# Altium schematic sheet CM5_Boot_USB.SchDoc: 05 - CM5: boot, USB, UART, I2C e ventilacao
size A3; Project: CM5 Photonic Bias Controller; DocumentRev: R5; ProjectRev: R5; Version: Rev R6; SheetNumber: 6; SheetTotal: 17; Author: Carlos Renan; SCH_SCALE: N/A; Address1: UFCG; Address2: Referencia: VIRTUS CC; Address3: Campina Grande - PB; ProjectName: Controle automatico de BIAS para MZM/IQ - Projeto 3; DocumentName: CM5_Boot_USB.SchDoc
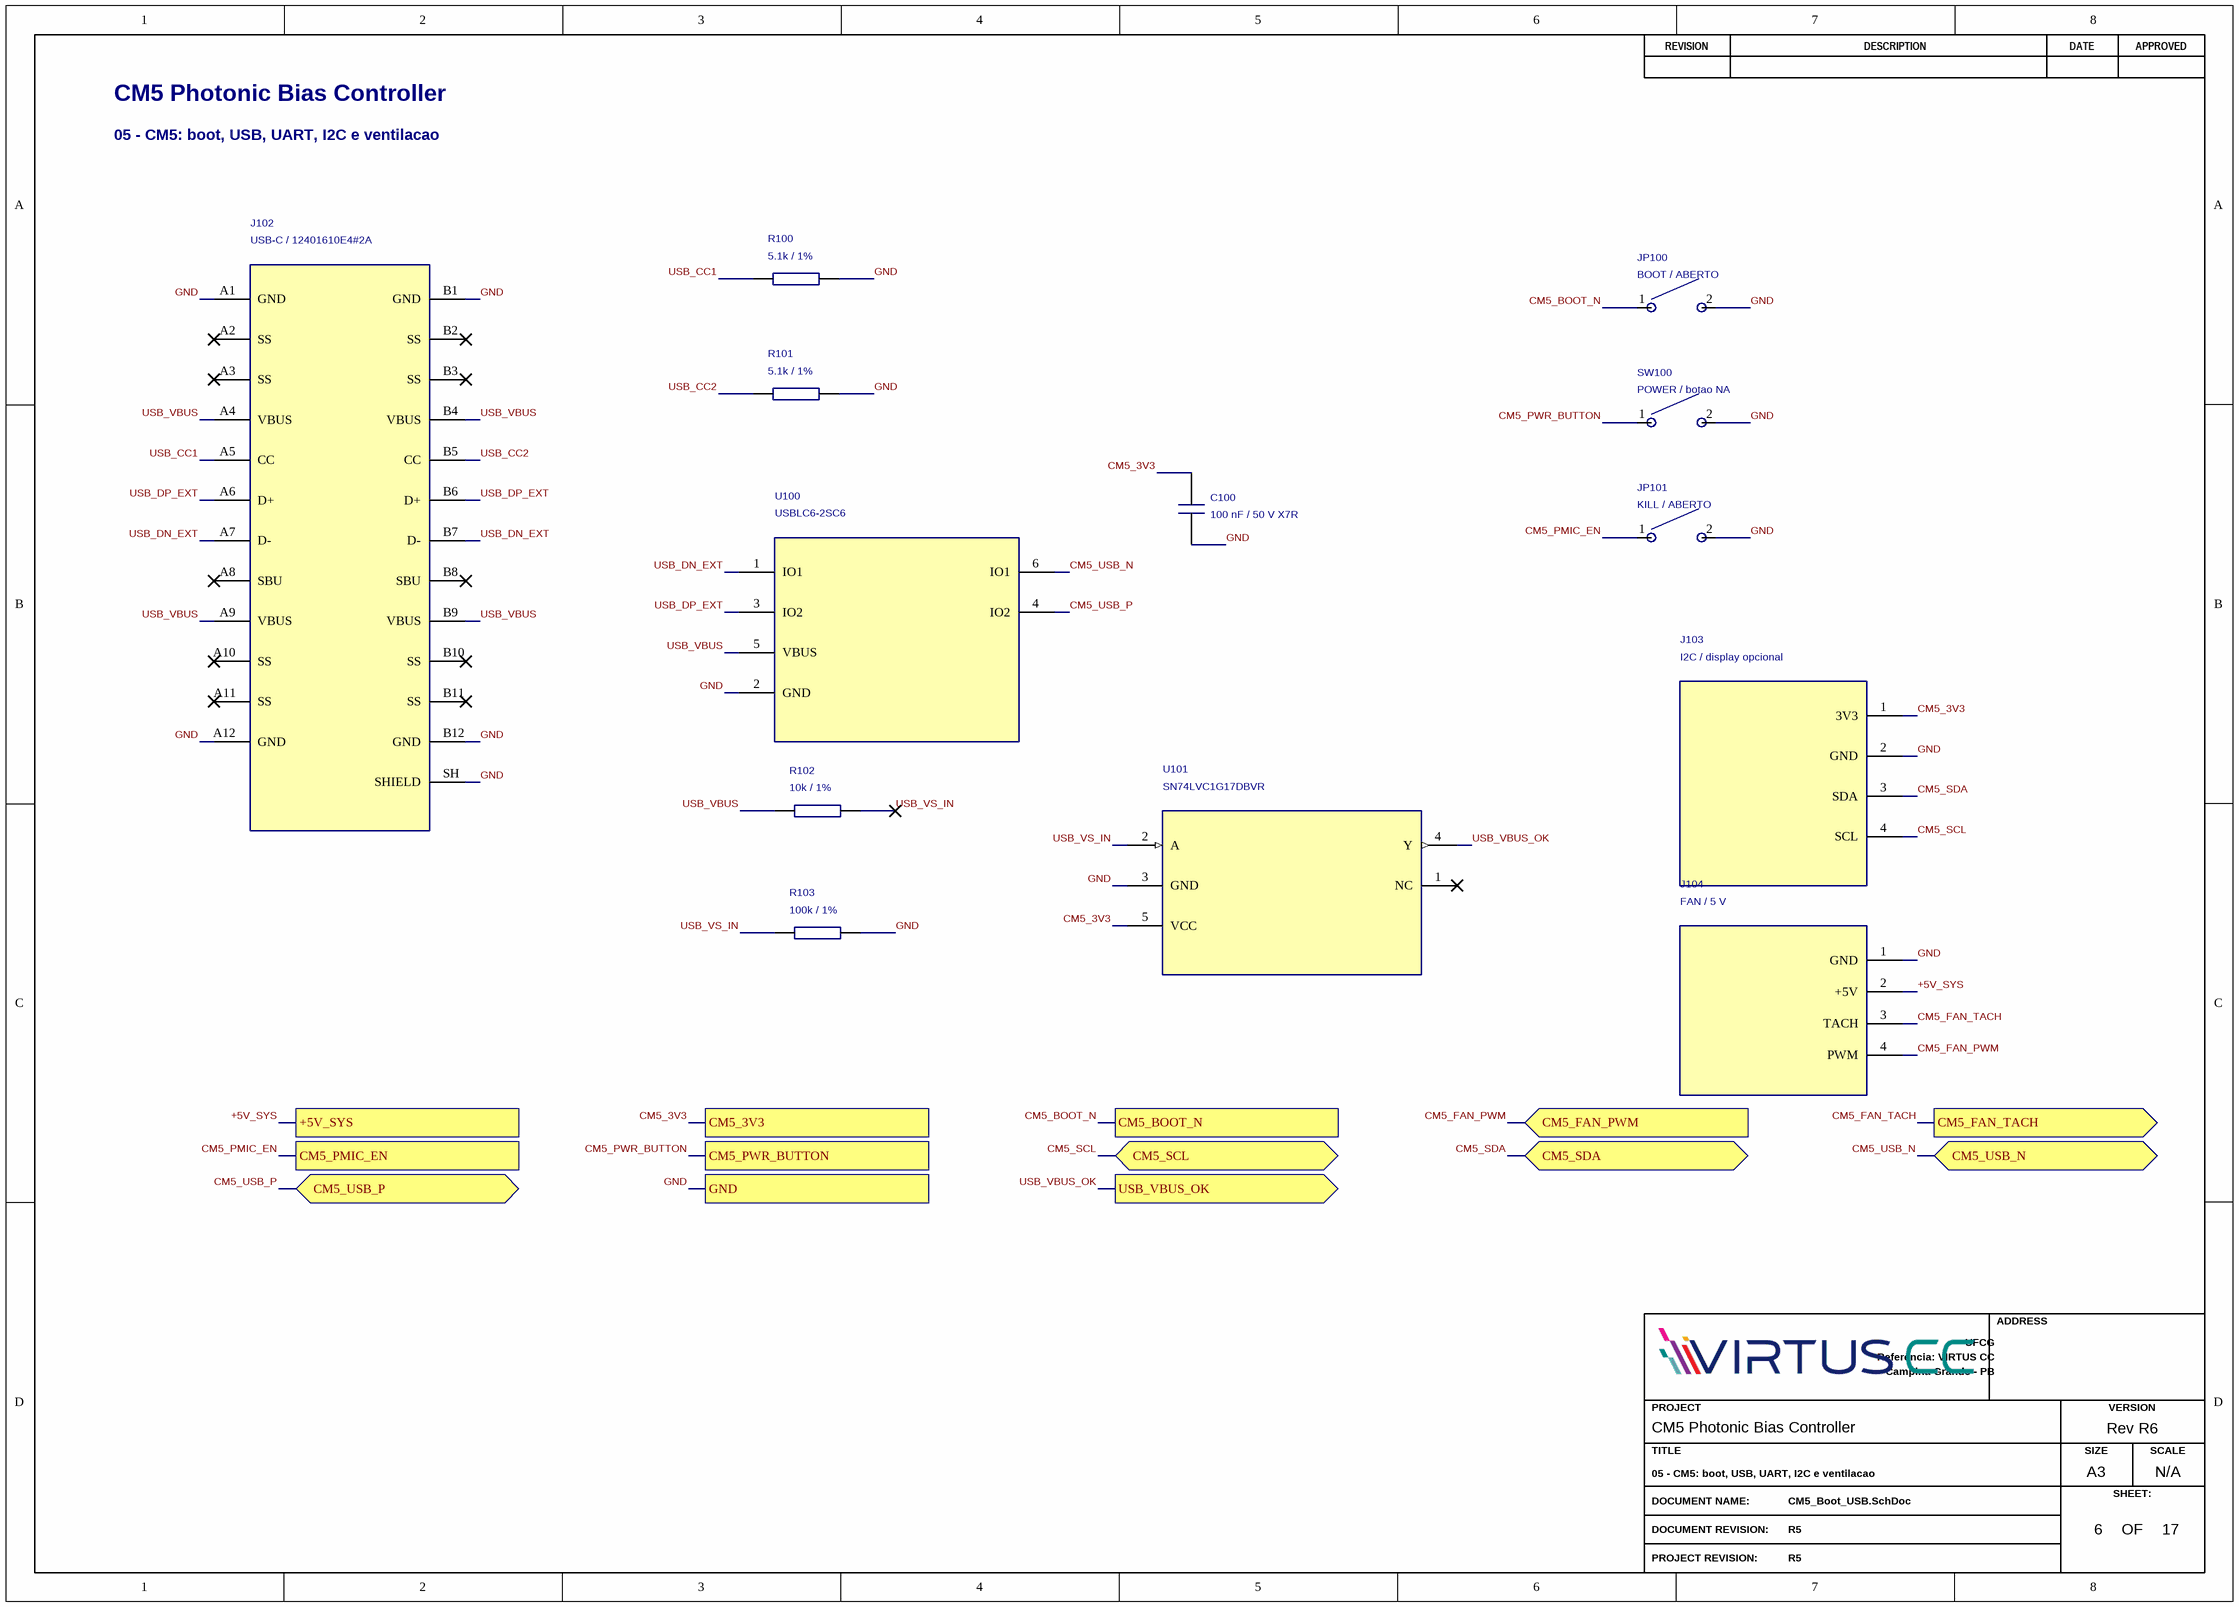
[diagram p0: CM5_Boot_USB.SchDoc]

## Parts
C100  100 nF / 50 V X7R  [C0805]
J102  USB-C / 12401610E4#2A  [USB_C_12401610]
J103  I2C / display opcional  [HDR_1X04_P254]
J104  FAN / 5 V  [HDR_1X04_P254]
JP100  BOOT / ABERTO  [HDR_1X02_P254]
JP101  KILL / ABERTO  [HDR_1X02_P254]
R100  5.1k / 1%  [R-0603]
R101  5.1k / 1%  [R-0603]
R102  10k / 1%  [R-0603]
R103  100k / 1%  [R-0603]
SW100  POWER / botao NA  [SW_TL3305A]
U100  USBLC6-2SC6  [SOT26]
U101  SN74LVC1G17DBVR  [FP-C04-091-OT-MFG]

## Ports
+5V_SYS, CM5_3V3, CM5_BOOT_N, CM5_FAN_PWM (in), CM5_FAN_TACH (out), CM5_PMIC_EN, CM5_PWR_BUTTON, CM5_SCL (bidir), CM5_SDA (bidir), CM5_USB_N (bidir), CM5_USB_P (bidir), GND, USB_VBUS_OK (out)

## Nets
+5V_SYS: J104.2(+5V) ; port +5V_SYS
CM5_3V3: C100.1 J103.1(3V3) U101.5(VCC) ; port CM5_3V3
CM5_BOOT_N: JP100.1 ; port CM5_BOOT_N
CM5_FAN_PWM: J104.4(PWM) ; port CM5_FAN_PWM
CM5_FAN_TACH: J104.3(TACH) ; port CM5_FAN_TACH
CM5_PMIC_EN: JP101.1 ; port CM5_PMIC_EN
CM5_PWR_BUTTON: SW100.1 ; port CM5_PWR_BUTTON
CM5_SCL: J103.4(SCL) ; port CM5_SCL
CM5_SDA: J103.3(SDA) ; port CM5_SDA
CM5_USB_N: U100.6(IO1) ; port CM5_USB_N
CM5_USB_P: U100.4(IO2) ; port CM5_USB_P
GND: C100.2 J102.A1(GND) J102.A12(GND) J102.B1(GND) J102.B12(GND) J102.SH(SHIELD) J103.2(GND) J104.1(GND) JP100.2 JP101.2 R100.2 R101.2 R103.2 SW100.2 U100.2(GND) U101.3(GND) ; port GND
USB_CC1: J102.A5(CC) R100.1
USB_CC2: J102.B5(CC) R101.1
USB_DN_EXT: J102.A7(D-) J102.B7(D-) U100.1(IO1)
USB_DP_EXT: J102.A6(D+) J102.B6(D+) U100.3(IO2)
USB_VBUS: J102.A4(VBUS) J102.A9(VBUS) J102.B4(VBUS) J102.B9(VBUS) R102.1 U100.5(VBUS)
USB_VBUS_OK: U101.4(Y) ; port USB_VBUS_OK
USB_VS_IN: R102.2 R103.1 U101.2(A)

Not connected (* = marked no-connect by the designer): J102 A2(SS)* A3(SS)* A8(SBU)* A10(SS)* A11(SS)* B2(SS)* B3(SS)* B8(SBU)* B10(SS)* B11(SS)*; U101 1(NC)*

## Notes on the sheet
- CM5 Photonic Bias Controller
- 05 - CM5: boot, USB, UART, I2C e ventilacao
- REVISION
- DESCRIPTION
- DATE
- APPROVED
- ADDRESS
- PROJECT
- VERSION
- TITLE
- A3
- SIZE
- SCALE
- DOCUMENT NAME:
- DOCUMENT REVISION:
- OF
- SHEET:
- PROJECT REVISION:

## Library data of the parts
C100 = 100 nF: Manufacturer: KEMET; Manufacturer Part Number: C0805C104K5RACTU; Procurement Status: Busca por MPN; SKU e disponibilidade a confirmar; BOM Purchase: Yes; Manufacturer 1: KEMET; Manufacturer Part Number 1: C0805C104K5RACTU; Supplier 1: DigiKey; Supplier URL 1: https://www.digikey.com.br/pt/products/result?keywords=C0805C104K5RACTU; Supplier 2: Mouser; Supplier URL 2: https://br.mouser.com/c/?q=C0805C104K5RACTU; Datasheet: https://www.yageogroup.com/download/specsheet/C0805C104K5RACTU
J102 = USB-C: Manufacturer: Amphenol Communications Solutions; Review: 24 contatos; SuperSpeed e SBU NC. Somente USB2; os quatro pads da carcaca sao SH.; Procurement Status: Busca por MPN; SKU e disponibilidade a confirmar; BOM Purchase: Yes; Manufacturer Part Number: 12401610E4#2A; Manufacturer 1: Amphenol Communications Solutions; Manufacturer Part Number 1: 12401610E4#2A; Supplier 1: DigiKey; Supplier URL 1: https://www.digikey.com.br/pt/products/result?keywords=12401610E4%232A; Supplier 2: Mouser; Supplier Part Number 2: 523-12401610E4#2A; Supplier URL 2: https://br.mouser.com/c/?q=12401610E4%232A; Datasheet: https://cdn.amphenol-cs.com/media/wysiwyg/files/drawing/c12401610_c.pdf
J103 = I2C: Manufacturer: Wurth Elektronik; Manufacturer Part Number: 61300411121; Review: Header reto 1x4 sem chave. Conferir sequencia de pinos do cabo do fan; nao pressupor conector PC padrao.; Procurement Status: Busca por MPN; SKU e disponibilidade a confirmar; BOM Purchase: Yes; Manufacturer 1: Wurth Elektronik; Manufacturer Part Number 1: 61300411121; Supplier 1: DigiKey; Supplier URL 1: https://www.digikey.com.br/pt/products/result?keywords=61300411121; Supplier 2: Mouser; Supplier URL 2: https://br.mouser.com/c/?q=61300411121; Datasheet: https://www.we-online.com/components/products/datasheet/61300411121.pdf
J104 = FAN: Manufacturer: Wurth Elektronik; Manufacturer Part Number: 61300411121; Review: Header reto 1x4 sem chave. Conferir sequencia de pinos do cabo do fan; nao pressupor conector PC padrao.; Procurement Status: Busca por MPN; SKU e disponibilidade a confirmar; BOM Purchase: Yes; Manufacturer 1: Wurth Elektronik; Manufacturer Part Number 1: 61300411121; Supplier 1: DigiKey; Supplier URL 1: https://www.digikey.com.br/pt/products/result?keywords=61300411121; Supplier 2: Mouser; Supplier URL 2: https://br.mouser.com/c/?q=61300411121; Datasheet: https://www.we-online.com/components/products/datasheet/61300411121.pdf
JP100 = BOOT: Manufacturer: Wurth Elektronik; Manufacturer Part Number: 61300211121; Review: Header 1x2; shunt removivel listado como acessorio. SW1000 inicia aberto.; Procurement Status: Busca por MPN; SKU e disponibilidade a confirmar; BOM Purchase: Yes; Manufacturer 1: Wurth Elektronik; Manufacturer Part Number 1: 61300211121; Supplier 1: DigiKey; Supplier URL 1: https://www.digikey.com.br/pt/products/result?keywords=61300211121; Supplier 2: Mouser; Supplier URL 2: https://br.mouser.com/c/?q=61300211121; Datasheet: https://www.we-online.com/components/products/datasheet/61300211121.pdf
JP101 = KILL: Manufacturer: Wurth Elektronik; Manufacturer Part Number: 61300211121; Review: Header 1x2; shunt removivel listado como acessorio. SW1000 inicia aberto.; Procurement Status: Busca por MPN; SKU e disponibilidade a confirmar; BOM Purchase: Yes; Manufacturer 1: Wurth Elektronik; Manufacturer Part Number 1: 61300211121; Supplier 1: DigiKey; Supplier URL 1: https://www.digikey.com.br/pt/products/result?keywords=61300211121; Supplier 2: Mouser; Supplier URL 2: https://br.mouser.com/c/?q=61300211121; Datasheet: https://www.we-online.com/components/products/datasheet/61300211121.pdf
R100 R101 = 5.1k: Manufacturer: YAGEO; Manufacturer Part Number: RC0603FR-075K1L; Procurement Status: Busca por MPN; SKU e disponibilidade a confirmar; BOM Purchase: Yes; Manufacturer 1: YAGEO; Manufacturer Part Number 1: RC0603FR-075K1L; Supplier 1: DigiKey; Supplier URL 1: https://www.digikey.com.br/pt/products/result?keywords=RC0603FR-075K1L; Supplier 2: Mouser; Supplier URL 2: https://br.mouser.com/c/?q=RC0603FR-075K1L; Datasheet: https://www.yageo.com/en/Product/Index/rchip
R102 = 10k: Manufacturer: YAGEO; Manufacturer Part Number: RC0603FR-0710KL; Procurement Status: Busca por MPN; SKU e disponibilidade a confirmar; BOM Purchase: Yes; Manufacturer 1: YAGEO; Manufacturer Part Number 1: RC0603FR-0710KL; Supplier 1: DigiKey; Supplier URL 1: https://www.digikey.com.br/pt/products/result?keywords=RC0603FR-0710KL; Supplier 2: Mouser; Supplier URL 2: https://br.mouser.com/c/?q=RC0603FR-0710KL; Datasheet: https://www.yageo.com/en/Product/Index/rchip
R103 = 100k: Manufacturer: YAGEO; Manufacturer Part Number: RC0603FR-07100KL; Procurement Status: Busca por MPN; SKU e disponibilidade a confirmar; BOM Purchase: Yes; Manufacturer 1: YAGEO; Manufacturer Part Number 1: RC0603FR-07100KL; Supplier 1: DigiKey; Supplier URL 1: https://www.digikey.com.br/pt/products/result?keywords=RC0603FR-07100KL; Supplier 2: Mouser; Supplier URL 2: https://br.mouser.com/c/?q=RC0603FR-07100KL; Datasheet: https://www.yageo.com/en/Product/Index/rchip
SW100 = POWER: Manufacturer: E-Switch; Manufacturer Part Number: TL3305AF160QG; Review: Botao normalmente aberto; quatro pads fisicos, dois numeros eletricos repetidos.; Procurement Status: Busca por MPN; SKU e disponibilidade a confirmar; BOM Purchase: Yes; Manufacturer 1: E-Switch; Manufacturer Part Number 1: TL3305AF160QG; Supplier 1: DigiKey; Supplier URL 1: https://www.digikey.com.br/pt/products/result?keywords=TL3305AF160QG; Supplier 2: Mouser; Supplier URL 2: https://br.mouser.com/c/?q=TL3305AF160QG; Datasheet: https://www.e-switch.com/product-catalog/tl3305-series-tact-switch/
U100 = USBLC6-2SC6: Manufacturer: STMicroelectronics; Procurement Status: Busca por MPN; SKU e disponibilidade a confirmar; BOM Purchase: Yes; Manufacturer Part Number: USBLC6-2SC6; Manufacturer 1: STMicroelectronics; Manufacturer Part Number 1: USBLC6-2SC6; Supplier 1: DigiKey; Supplier URL 1: https://www.digikey.com.br/pt/products/result?keywords=USBLC6-2SC6; Supplier 2: Mouser; Supplier URL 2: https://br.mouser.com/c/?q=USBLC6-2SC6; Datasheet: https://www.st.com/resource/en/datasheet/usblc6-2.pdf
U101 = SN74LVC1G17DBVR: Manufacturer: Texas Instruments; Procurement Status: Busca por MPN; SKU e disponibilidade a confirmar; BOM Purchase: Yes; Manufacturer Part Number: SN74LVC1G17DBVR; Manufacturer 1: Texas Instruments; Manufacturer Part Number 1: SN74LVC1G17DBVR; Supplier 1: DigiKey; Supplier URL 1: https://www.digikey.com.br/pt/products/result?keywords=SN74LVC1G17DBVR; Supplier 2: Mouser; Supplier URL 2: https://br.mouser.com/c/?q=SN74LVC1G17DBVR; Datasheet: https://www.ti.com/lit/ds/symlink/sn74lvc1g17.pdf